# Altium schematic sheet Wiring_connection_scheme_J3.SchDoc: =DT_SCH_Title
size A4; Organization: Droid Technologies; SheetNumber: 21; SheetTotal: 22
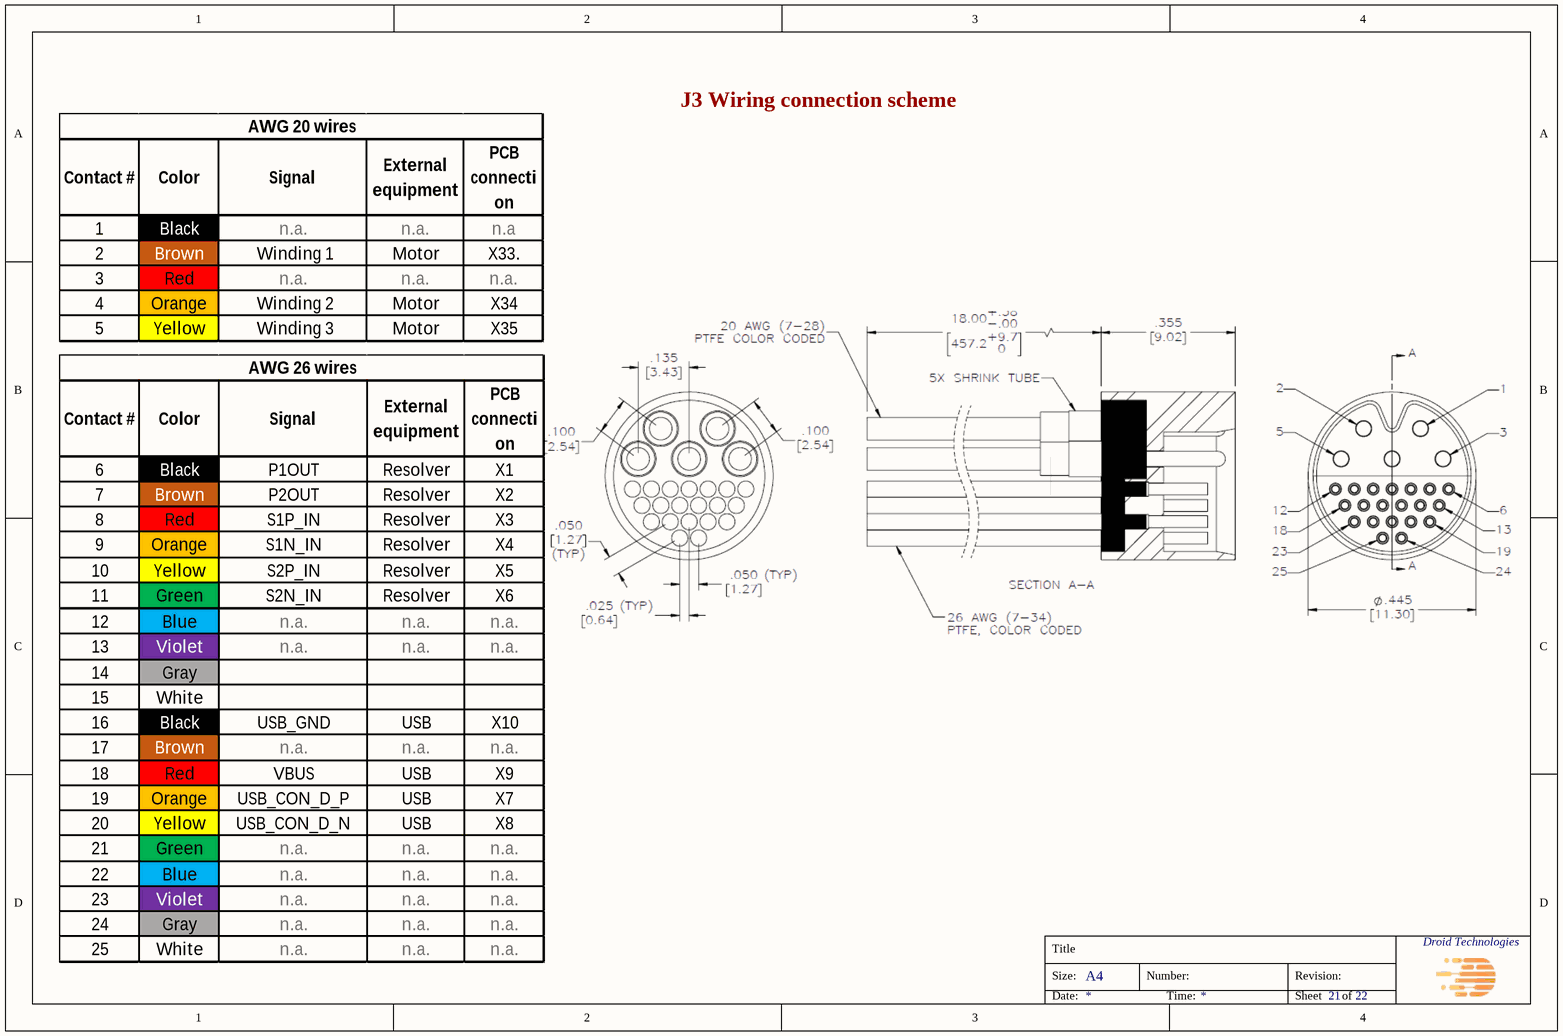
[diagram p0: Wiring_connection_scheme_J3.SchDoc]

## Notes on the sheet
- J3 Wiring connection scheme
- RTC_BAT
- RTC_GND
- RTC BAT
- X36
- X37
- Title
- Size:
- A4
- Number:
- Revision:
- Date:
- Time:
- Sheet
- of